# Altium project MD045B.PrjPcb (part 1 of 2)
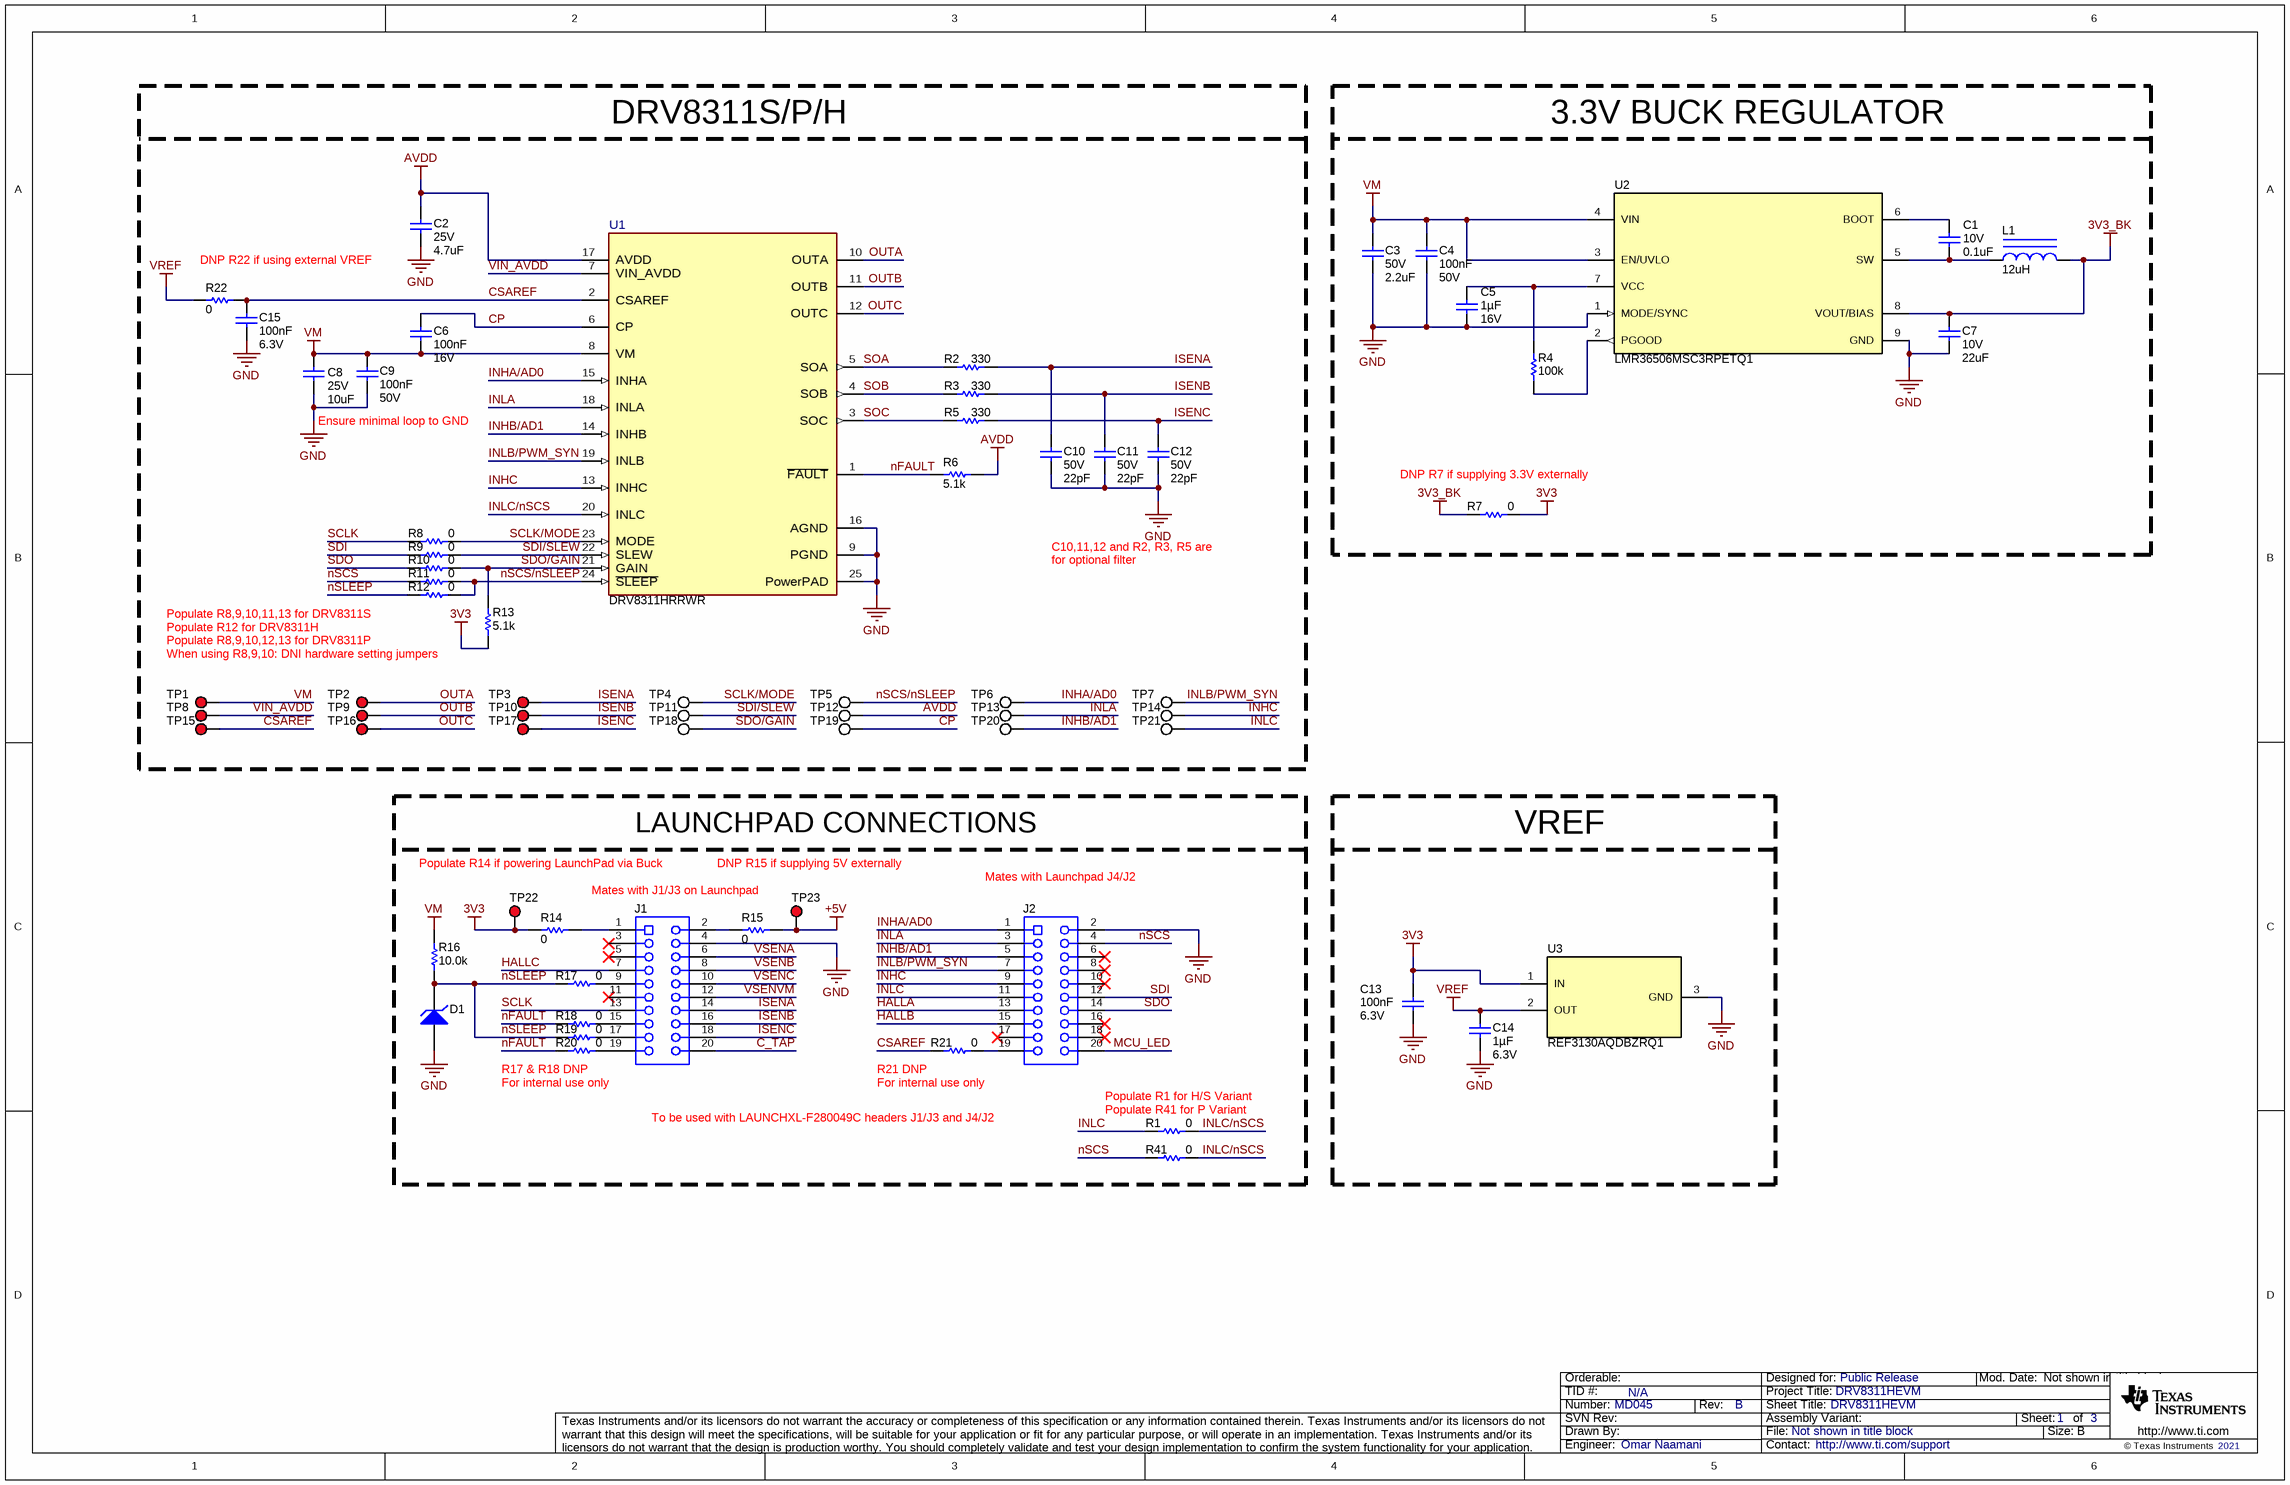
[diagram p0: MD045B_DRIVER.SchDoc]
title: DRV8311HEVM; TID: N/A; TechSupport: http://www.ti.com/support; SCH_Rev: B; PRJ_Title: DRV8311HEVM; PRJ_Number: MD045; PRJ_Engineer: Omar Naamani; PRJ_Customer: Public Release; PCB_Rev: B; PCB_Layout: Omar Naamani; CopyrightYear: 2021
3 sheets, 147 parts. Net scope: global (net labels, ports and power ports of the same name join across sheets).
Board file: MD045B_PCB.PcbDoc
Sheets:
  MD045B_DRIVER.SchDoc
  MD045B_HARDWARE.SchDoc
  MD045B_POWER_AND_CONNECTORS.SchDoc

## Sheet MD045B_DRIVER.SchDoc: DRV8311HEVM
size 431 x 279 mm; Date: Not shown in title block; ApprovedBy: Not shown in title block; CheckedBy: Not shown in title block; Author: Not shown in title block; CompanyName: Not shown in title block; Engineer: Not shown in title block; Organization: Not shown in title block; Address1: Not shown in title block; Address2: Not shown in title block; Address3: Not shown in title block; Address4: Not shown in title block; DocumentNumber: 1; Revision: Use project parameter SCH_Rev; SheetNumber: 1; SheetTotal: 3; PageSetup: Record=PageOptions|CenterHorizontal=True|CenterVertical=True|PrintScale=1.00|XCorrection=1.00|YCorrection=1.00|PrintKind=0|BorderSize=5000000|LeftOffset=0|BottomOffset=0|Orientation=2|PaperLength=1000|PaperWidth=1000|Scale=100|PaperSource=15|PrintQuality=600|MediaType=1|DitherType=10|PaperKind=Letter|PrintScaleMode=1; CurrentTime: Not shown in title block; CurrentDate: Not shown in title block; Time: Not shown in title block; DocumentFullPathAndName: Not shown in title block; DocumentName: Not shown in title block; ModifiedDate: Not shown in title block; ImagePath: Not shown in title block

### Parts
C1  VDC_V: 10V  ValueDisplayed: 0.1uF  [0402L]  (hidden comment: CL05B104KP5NNNC)
C2  VDC_V: 25V  ValueDisplayed: 4.7uF  [0603L]  (hidden comment: GRM188R61E475KE11D)
C3  VDC_V: 50V  ValueDisplayed: 2.2uF  [1210_280]  (hidden comment: C3225X7R1H225K250AB)
C4  Cap_F: 100nF  VDC_V: 50V  [0805L]  (hidden comment: C0805C104K5RACAUTO)
C5  Cap_F: 1µF  VDC_V: 16V  [0603L]  (hidden comment: EMK107B7105KA-T)
C6  Cap_F: 100nF  VDC_V: 16V  [0603L]  (hidden comment: CL10B104KO8NNNC)
C7  VDC_V: 10V  ValueDisplayed: 22uF  [1206_180L]  (hidden comment: GRM31CR71A226KE15L)
C8  VDC_V: 25V  ValueDisplayed: 10uF  [0805L]  (hidden comment: GRM21BC71E106KE11L)
C9  Cap_F: 100nF  VDC_V: 50V  [0805L]  (hidden comment: C0805C104K5RACAUTO)
C10  VDC_V: 50V  ValueDisplayed: 22pF  [0603L]  (hidden comment: CGA3E2C0G1H220J080AA)
C11  VDC_V: 50V  ValueDisplayed: 22pF  [0603L]  (hidden comment: CGA3E2C0G1H220J080AA)
C12  VDC_V: 50V  ValueDisplayed: 22pF  [0603L]  (hidden comment: CGA3E2C0G1H220J080AA)
C13  Cap_F: 100nF  VDC_V: 6.3V  [0603L]  (hidden comment: C0603C104K9RAC7867)
C14  Cap_F: 1µF  VDC_V: 6.3V  [0603L]  (hidden comment: CL10B105KQ8NNNC)
C15  Cap_F: 100nF  VDC_V: 6.3V  [0603L]  (hidden comment: C0603C104K9RAC7867)
D1  SZMM3Z3V3ST1G  [SOD-323]  (value not drawn)
J1  SSQ-110-03-G-D  [Samtec_SSQ-110-03-x-D]  (value not drawn)
J2  SSQ-110-03-G-D  [Samtec_SSQ-110-03-x-D]  (value not drawn)
L1  ValueDisplayed: 12uH  [SDR0805]  (hidden comment: SDR0805-120ML)
R1  ValueDisplayed: 0  [0603L]  (hidden comment: ERJ-3GEY0R00V)
R2  ValueDisplayed: 330  [0603L]  (hidden comment: RC0603FR-07330RL)
R3  ValueDisplayed: 330  [0603L]  (hidden comment: RC0603FR-07330RL)
R4  ValueDisplayed: 100k  [0603L]  (hidden comment: CRCW0603100KFKEA)
R5  ValueDisplayed: 330  [0603L]  (hidden comment: RC0603FR-07330RL)
R6  ValueDisplayed: 5.1k  [0603L]  (hidden comment: CRCW06035K10JNEA)
R7  ValueDisplayed: 0  [0603L]  (hidden comment: ERJ-3GEY0R00V)
R8  ValueDisplayed: 0  [0603L]  (hidden comment: ERJ-3GEY0R00V)
R9  ValueDisplayed: 0  [0603L]  (hidden comment: ERJ-3GEY0R00V)
R10  ValueDisplayed: 0  [0603L]  (hidden comment: ERJ-3GEY0R00V)
R11  ValueDisplayed: 0  [0603L]  (hidden comment: ERJ-3GEY0R00V)
R12  ValueDisplayed: 0  [0603L]  (hidden comment: ERJ-3GEY0R00V)
R13  ValueDisplayed: 5.1k  [0603L]  (hidden comment: CRCW06035K10JNEA)
R14  ValueDisplayed: 0  [0805L]  (hidden comment: ERJ-6GEY0R00V)
R15  ValueDisplayed: 0  [0805L]  (hidden comment: ERJ-6GEY0R00V)
R16  ValueDisplayed: 10.0k  [TNPW0603]  (hidden comment: TNPW060310K0BEEA)
R17  ValueDisplayed: 0  [0603L]  (hidden comment: ERJ-3GEY0R00V)
R18  ValueDisplayed: 0  [0603L]  (hidden comment: ERJ-3GEY0R00V)
R19  ValueDisplayed: 0  [0603L]  (hidden comment: ERJ-3GEY0R00V)
R20  ValueDisplayed: 0  [0603L]  (hidden comment: ERJ-3GEY0R00V)
R21  ValueDisplayed: 0  [0603L]  (hidden comment: ERJ-3GEY0R00V)
R22  ValueDisplayed: 0  [0603L]  (hidden comment: ERJ-3GEY0R00V)
R41  ValueDisplayed: 0  [0603L]  (hidden comment: ERJ-3GEY0R00V)
TP1  VM  [Keystone5000]  (value not drawn)
TP2  OUTA  [Keystone5000]  (value not drawn)
TP3  ISENA  [Keystone5000]  (value not drawn)
TP4  SCLK  [Testpoint_Keystone_Miniature]  (value not drawn)
TP5  nSCS  [Testpoint_Keystone_Miniature]  (value not drawn)
TP6  INHA  [Testpoint_Keystone_Miniature]  (value not drawn)
TP7  INLB  [Testpoint_Keystone_Miniature]  (value not drawn)
TP8  VIN_AVDD  [Keystone5000]  (value not drawn)
TP9  OUTB  [Keystone5000]  (value not drawn)
TP10  ISENB  [Keystone5000]  (value not drawn)
TP11  SDI  [Testpoint_Keystone_Miniature]  (value not drawn)
TP12  AVDD  [Testpoint_Keystone_Miniature]  (value not drawn)
TP13  INLA  [Testpoint_Keystone_Miniature]  (value not drawn)
TP14  INHC  [Testpoint_Keystone_Miniature]  (value not drawn)
TP15  CSAREF  [Keystone5000]  (value not drawn)
TP16  OUTC  [Keystone5000]  (value not drawn)
TP17  ISENC  [Keystone5000]  (value not drawn)
TP18  SDO  [Testpoint_Keystone_Miniature]  (value not drawn)
TP19  CP  [Testpoint_Keystone_Miniature]  (value not drawn)
TP20  INHB  [Testpoint_Keystone_Miniature]  (value not drawn)
TP21  INLC  [Testpoint_Keystone_Miniature]  (value not drawn)
TP22  3V3  [Keystone5000]  (value not drawn)
TP23  5V  [Keystone5000]  (value not drawn)
U1  DRV8311HRRWR  [RRW0024-MFG]
U2  LMR36506MSC3RPETQ1  [RPE0009A]
U3  REF3130AQDBZRQ1  [DBZ0003A_N]

### Blocks framed on the sheet
DRV8311S/P/H: C2 C6 C8-C12 C15 R2 R3 R5 R6 R8-R13 R22 TP1-TP21 U1
3.3V BUCK REGULATOR: C1 C3-C5 C7 L1 R4 R7 U2
LAUNCHPAD CONNECTIONS: D1 J1 J2 R1 R14-R21 R41 TP22 TP23
VREF: C13 C14 U3

### Nets
3V3: C13.1 R7.2 R13.1 R14.1 TP22.1 U3.1(IN)
3V3_BK: C7.1 L1.2 R7.1 U2.8(VOUT/BIAS)
+5V: R15.2 TP23.1
AVDD: C2.1 R6.1 TP12.1 U1.17(AVDD)
GND: C2.2 C3.2 C4.2 C5.2 C7.2 C8.2 C9.2 C10.2 C11.2 C12.2 C13.2 C14.2 C15.2 D1.2(A) J1.4 J2.2 U1.9(PGND) U1.16(AGND) U1.25(PowerPAD) U2.1(MODE/SYNC) U2.9(GND) U3.3(GND)
VIN_AVDD: TP8.1 U1.7(VIN_AVDD)
VM: C3.1 C4.1 C6.2 C8.1 C9.1 R16.2 TP1.1 U1.8(VM) U2.3(EN/UVLO) U2.4(VIN)
VREF: C14.1 R22.2 U3.2(OUT)
C_TAP: J1.20
CP: C6.1 TP19.1 U1.6(CP)
CSAREF: C15.1 R21.1 R22.1 TP15.1 U1.2(CSAREF)
HALLA: J2.13
HALLB: J2.15
HALLC: J1.7
INHA/AD0: J2.1 TP6.1 U1.15(INHA)
INHB/AD1: J2.5 TP20.1 U1.14(INHB)
INHC: J2.9 TP14.1 U1.13(INHC)
INLA: J2.3 TP13.1 U1.18(INLA)
INLB/PWM_SYN: J2.7 TP7.1 U1.19(INLB)
INLC: J2.11 R1.1 TP21.1
INLC/nSCS: R1.2 R41.2 U1.20(INLC)
ISENA: C10.1 J1.14 R2.1 TP3.1
ISENB: C11.1 J1.16 R3.1 TP10.1
ISENC: C12.1 J1.18 R5.1 TP17.1
MCU_LED: J2.20
nFAULT: R6.2 R18.1 R20.1 U1.1(~{FAULT})
nSCS: J2.4 R11.1 R41.1
nSCS/nSLEEP: R11.2 R12.2 TP5.1 U1.24(~{SLEEP})
nSLEEP: D1.1(K) R12.1 R16.1 R17.1 R19.1
OUTA: TP2.1 U1.10(OUTA)
OUTB: TP9.1 U1.11(OUTB)
OUTC: TP16.1 U1.12(OUTC)
SCLK: J1.13 R8.1
SCLK/MODE: R8.2 TP4.1 U1.23(MODE)
SDI: J2.12 R9.1
SDI/SLEW: R9.2 TP11.1 U1.22(SLEW)
SDO: J2.14 R10.1
SDO/GAIN: R10.2 R13.2 TP18.1 U1.21(GAIN)
SOA: R2.2 U1.5(SOA)
SOB: R3.2 U1.4(SOB)
SOC: R5.2 U1.3(SOC)
VSENA: J1.6
VSENB: J1.8
VSENC: J1.10
VSENVM: J1.12
NetC1_1: C1.1 U2.6(BOOT)
NetC1_2: C1.2 L1.1 U2.5(SW)
NetC5_1: C5.1 R4.1 U2.7(VCC)
NetJ1_1: J1.1 R14.2
NetJ1_2: J1.2 R15.1
NetJ1_9: J1.9 R17.2
NetJ1_15: J1.15 R18.2
NetJ1_17: J1.17 R19.2
NetJ1_19: J1.19 R20.2
NetJ2_19: J2.19 R21.2
NetR4_2: R4.2 U2.2(PGOOD)

Not connected (* = marked no-connect by the designer): J1 3* 5* 11*; J2 6* 8* 10* 16* 17* 18*

### Notes on the sheet
- DNP R22 if using external VREF
- Ensure minimal loop to GND
- (near R7) DNP R7 if supplying 3.3V externally
- C10,11,12 and R2, R3, R5 are
- for optional filter
- Populate R8,9,10,11,13 for DRV8311S
- Populate R12 for DRV8311H
- When using R8,9,10: DNI hardware setting jumpers
- Populate R8,9,10,12,13 for DRV8311P
- Populate R14 if powering LaunchPad via Buck
- Mates with J1/J3 on Launchpad
- DNP R15 if supplying 5V externally
- (near J2) Mates with Launchpad J4/J2
- (near R20) R17 & R18 DNP
- For internal use only
- (near R21) R21 DNP
- (near R1) Populate R1 for H/S Variant
- To be used with LAUNCHXL-F280049C headers J1/J3 and J4/J2
- (near R1) Populate R41 for P Variant
- Drawn By:
- SVN Rev:
- Number:
- TID #:
- Orderable:
- Rev:
- Sheet Title:
- File:
- Project Title:
- Designed for:
- Assembly Variant:
- Mod. Date:
- Sheet:
- Size:
- of
- B
- http://www.ti.com
- Texas Instruments and/or its licensors do not warrant the accuracy or completeness of this specification or any information contained therein. Texas Instruments and/or its licensors do not warrant that this design will meet the specifications, will be suitable for your application or fit for any particular purpose, or will operate in an implementation. Texas Instruments and/or its licensors do not warrant that the design is production worthy. You should completely validate and test your design implementation to confirm the system functionality for your application.
- Engineer:
- Contact:
- © Texas Instruments

### Library data of the parts
C1 = CMP-0006343-2: CAP, CERM, 0.1 uF, 10 V, +/- 10%, X7R, 0402; Manufacturer: Samsung Electro-Mechanics; TaMin_C: -55°C; Polarized: N; SizeAreaWB_mm2: 3; Value1: Unknown; U/M: EA; Value: 0.1uF; TaMax_C: 125°C; SizeZ_mm: 0.6; SizeX_mm: 1; SizeY_mm: 0.5; Cap_Case: 0402; Cap_F: 100nF; AEC Category: Q200; Publisher: Texas Instruments; TempCo: X7R; Published: 2008-06-19; RoHS: Y; MountType: SMT; PackageReference: 0402; Tolerance_%: 10%; Value2: 10V; SizeArea_mm2: 0.5; CompType: Capacitor; LatestRevisionDate: 2017-03-09; PartNumber: CL05B104KP5NNNC; AEC Qualified: N; ComponentLink1Description: Datasheet link; AEC Grade: N/A; Technology: Ceramic; ComponentLink1URL: http://www.samsungsem.com/kr/front/downloadcms.do?path=/kr/support/product-search/mlcc/__icsFiles/afieldfile/2014/11/05&fileName=S_CL05B104KP5NNNC.pdf
C2 = CMP-0007347-5: CAP, CERM, 4.7 uF, 25 V, +/- 10%, X5R, 0603; Manufacturer: MuRata; TaMin_C: -55°C; Polarized: N; SizeAreaWB_mm2: 4.68; Value1: Unknown; U/M: EA; Value: 4.7uF; TaMax_C: 85°C; SizeZ_mm: 1; SizeX_mm: 1.6; SizeY_mm: 0.8; Cap_Case: 0603; SizeArea_mm2: 1.28; Cap_F: 4.7µF; AEC Category: Q200; Supplier Part Number 2: 68X2788; Supplier 2: Newark; Supplier Part Number 3: 81-GRM188R61E475KE1D; TempCo: X5R; Supplier 3: Mouser; Published: 2008-06-19; RoHS: Y; MountType: SMT; Supplier 1: Digi-Key; Publisher: Texas Instruments; PackageReference: 0603; Tolerance_%: 10%; Value2: 25V; CompType: Capacitor; LatestRevisionDate: 2017-03-09; PartNumber: GRM188R61E475KE11D; AEC Qualified: N; ComponentLink1Description: Datasheet link; AEC Grade: N/A; Supplier Part Number 1: 490-7203-1-ND; Technology: Ceramic; ComponentLink1URL: http://search.murata.co.jp/Ceramy/image/img/A01X/G101/ENG/GRM188R61E475KE11-01.pdf
C3 = CMP-0009122-1: CAP, CERM, 2.2 uF, 50 V, +/- 10%, X7R, 1210; Manufacturer: TDK; TaMin_C: -55°C; ESR_ohm: 5.36m; Polarized: N; SizeAreaWB_mm2: 14.7; Value1: 0.00536 ohm; U/M: EA; Value: 2.2uF; TaMax_C: 125°C; SizeZ_mm: 2.8; SizeX_mm: 3.2; SizeY_mm: 2.5; SizeArea_mm2: 8; Cap_F: 2.2µF; IRMS_A: 3.17778A; AEC Category: Q200; ComponentLink1URL: https://product.tdk.com/en/search/capacitor/ceramic/mlcc/info?part_no=C3225X7R1H225K250AB; Supplier Part Number 2: 87R4491; Publisher: Texas Instruments; Supplier 2: Newark; Supplier Part Number 3: 810-C3225X7R1H225K11; TempCo: X7R; Supplier 3: Mouser; Published: 2008-06-19; RoHS: Y; MountType: SMT; Supplier 1: Digi-Key; PackageReference: 1210; Tolerance_%: 10%; Cap_Case: 1210_280; Value2: 50V; CompType: Capacitor; LatestRevisionDate: 2017-03-09; PartNumber: C3225X7R1H225K250AB; AEC Qualified: N; ComponentLink1Description: Datasheet link; AEC Grade: N/A; Supplier Part Number 1: 445-1431-1-ND; Technology: Ceramic
C4 C9 = CMP-0007725-2: CAP, CERM, 0.1 uF, 50 V, +/- 10%, X7R, AEC-Q200 Grade 0, 0805; Manufacturer: Kemet; TaMin_C: -55°C; Polarized: N; SizeAreaWB_mm2: 6.75; Value1: Unknown; U/M: EA; Value: 0.1uF; TaMax_C: 125°C; SizeZ_mm: 1.45; SizeX_mm: 2; SizeY_mm: 1.25; Cap_Case: 0805; SizeArea_mm2: 2.5; AEC Qualified: Y; AEC Grade: 0; AEC Category: Q200; Supplier Part Number 2: 86T2620; Publisher: Texas Instruments; Supplier 2: Newark; Supplier Part Number 3: 80-C0805C104K5RAUTO; TempCo: X7R; Supplier 3: Mouser; Published: 2008-06-19; RoHS: Y; MountType: SMT; Supplier 1: Digi-Key; PackageReference: 0805; Tolerance_%: 10%; Value2: 50V; CompType: Capacitor; LatestRevisionDate: 2017-03-09; PartNumber: C0805C104K5RACAUTO; ComponentLink1Description: Datasheet link; Supplier Part Number 1: 399-6928-1-ND; Technology: Ceramic; ValueDisplayed: 0.1uF; ComponentLink1URL: http://www.kemet.com/Lists/ProductCatalog/Attachments/53/KEM_C1002_X7R_SMD.pdf
C5 = CMP-0007120-4: CAP, CERM, 1 uF, 16 V, +/- 10%, X7R, 0603; Manufacturer: Taiyo Yuden; TaMin_C: -55°C; Polarized: N; SizeAreaWB_mm2: 4.68; Value1: Unknown; U/M: EA; Value: 1uF; TaMax_C: 85°C; SizeZ_mm: 1; SizeX_mm: 1.6; SizeY_mm: 0.8; Cap_Case: 0603; SizeArea_mm2: 1.28; AEC Category: Q200; Publisher: Texas Instruments; TempCo: X7R; Published: 2008-06-19; RoHS: Y; MountType: SMT; Supplier 1: Farnell; PackageReference: 0603; Tolerance_%: 10%; Value2: 16V; CompType: Capacitor; LatestRevisionDate: 2017-03-09; PartNumber: EMK107B7105KA-T; AEC Qualified: ?; ComponentLink1Description: Datasheet link; Supplier Part Number 1: 1683647; Technology: Ceramic; ValueDisplayed: 1uF; ComponentLink1URL: http://www.yuden.co.jp/ut/product/pdf/djmk_e.pdf
C6 = CMP-0007110-4: CAP, CERM, 0.1 uF, 16 V, +/- 10%, X7R, 0603; Manufacturer: Samsung Electro-Mechanics; TaMin_C: -55°C; Polarized: N; SizeAreaWB_mm2: 4.68; Value1: Unknown; U/M: EA; Value: 0.1uF; TaMax_C: 125°C; SizeZ_mm: 1; SizeX_mm: 1.6; SizeY_mm: 0.8; Cap_Case: 0603; SizeArea_mm2: 1.28; AEC Category: Q200; Publisher: Texas Instruments; TempCo: X7R; Published: 2008-06-19; RoHS: Y; MountType: SMT; PackageReference: 0603; Tolerance_%: 10%; Value2: 16V; CompType: Capacitor; LatestRevisionDate: 2017-03-09; PartNumber: CL10B104KO8NNNC; AEC Qualified: ?; ComponentLink1Description: Datasheet link; Technology: Ceramic; ValueDisplayed: 0.1uF; ComponentLink1URL: http://www.samsungsem.com/kr/front/downloadcms.do?path=/kr/support/product-search/mlcc/__icsFiles/afieldfile/2014/11/05&fileName=S_CL10B104KO8NNNC.pdf
C7 = CMP-0008959-2: CAP, CERM, 22 uF, 10 V, +/- 10%, X7R, 1206; Manufacturer: MuRata; TaMin_C: -55°C; Polarized: N; SizeAreaWB_mm2: 10.92; Value1: Unknown; U/M: EA; Value: 22uF; TaMax_C: 125°C; SizeZ_mm: 1.8; SizeX_mm: 3.2; SizeY_mm: 1.6; Cap_Case: 1206; SizeArea_mm2: 5.12; Cap_F: 22µF; AEC Category: Q200; Supplier Part Number 2: 81-GRM31CR71A226K15L; Publisher: Texas Instruments; Supplier 2: Mouser; Supplier Part Number 3: 1797016; TempCo: X7R; Supplier 3: Farnell; Published: 2008-06-19; RoHS: Y; MountType: SMT; Supplier 1: Digi-Key; PackageReference: 1206; Tolerance_%: 10%; Value2: 10V; CompType: Capacitor; LatestRevisionDate: 2017-03-09; PartNumber: GRM31CR71A226KE15L; AEC Qualified: ?; ComponentLink1Description: Datasheet link; Supplier Part Number 1: 490-5309-1-ND; Technology: Ceramic; ComponentLink1URL: http://search.murata.co.jp/Ceramy/PnsearchViewAction.do?HnOFG=ON&HnNFG=ON&SEL_CNT=50&sLang=en&sKey=GRM31CR71A226KE15L&x=9&y=9&search=startwith
C8 = CMP-0008262-2: CAP, CERM, 10 uF, 25 V, +/- 10%, X7S, 0805; Manufacturer: MuRata; TaMin_C: -55°C; Polarized: N; SizeAreaWB_mm2: 6.75; Value1: Unknown; U/M: EA; Value: 10uF; TaMax_C: 125°C; SizeZ_mm: 1.45; SizeX_mm: 2; SizeY_mm: 1.25; Cap_Case: 0805; SizeArea_mm2: 2.5; Cap_F: 10µF; AEC Category: Q200; Supplier Part Number 2: 81-GRM21BC71E106KE1L; Publisher: Texas Instruments; Supplier 2: Mouser; TempCo: X7S; Published: 2008-06-19; RoHS: Y; MountType: SMT; Supplier 1: Digi-Key; PackageReference: 0805; Tolerance_%: 10%; Value2: 25V; CompType: Capacitor; LatestRevisionDate: 2017-03-09; PartNumber: GRM21BC71E106KE11L; AEC Qualified: N; ComponentLink1Description: Datasheet link; AEC Grade: N/A; Supplier Part Number 1: 490-10496-1-ND; Technology: Ceramic; ComponentLink1URL: http://psearch.en.murata.com/capacitor/product/GRM21BC71E106KE11%23.pdf
C10-C12 = CMP-0007071-4: CAP, CERM, 22 pF, 50 V, +/- 5%, C0G/NP0, AEC-Q200 Grade 1, 0603; Manufacturer: TDK; TaMin_C: -55°C; Polarized: N; SizeAreaWB_mm2: 4.68; Value1: Unknown; U/M: EA; Value: 22pF; TaMax_C: 125°C; SizeZ_mm: 1; SizeX_mm: 1.6; SizeY_mm: 0.8; Cap_Case: 0603; SizeArea_mm2: 1.28; AEC Qualified: Y; AEC Category: Q200; Supplier Part Number 2: 12T1569; Publisher: Texas Instruments; Supplier 2: Newark; Supplier Part Number 3: 810-CGA3E2C0G1H220J; TempCo: C0G/NP0; Supplier 3: Mouser; Published: 2008-06-19; RoHS: Y; MountType: SMT; Supplier 1: Digi-Key; PackageReference: 0603; Tolerance_%: 5%; Value2: 50V; CompType: Capacitor; LatestRevisionDate: 2017-03-09; PartNumber: CGA3E2C0G1H220J080AA; Cap_F: 22pF; ComponentLink1Description: Datasheet link; AEC Grade: 1; Supplier Part Number 1: 445-5632-1-ND; Technology: Ceramic; ComponentLink1URL: http://product.tdk.com/en/catalog/datasheets/mlcc_automotive_general_en.pdf
C13 C15 = CMP-0086271-1: CAP, CERM, 0.1 µF, 6.3 V,+/- 10%, X7R, 0603; Manufacturer: Kemet; AEC Category: Q200; ValueDisplayed: 0.1µF; Polarized: N; SizeArea_mm2: 1.28; TaMax_C: 125°C; SizeY_mm: 0.8; Value: 0.1uF; SizeAreaWB_mm2: 4.68; SizeZ_mm: 1; Cap_Case: 0603; SizeX_mm: 1.6; U/M: EA; TaMin_C: -55°C; ComponentLink1Description: Datasheet link; TempCo: X7R; Value2: 6.3V; AEC Grade: N/A; AEC Qualified: N; PackageReference: 0603; RoHS: Y; CompType: Capacitor; MountType: SMT; Technology: Ceramic; PartNumber: C0603C104K9RAC7867; Tolerance_%: 10%; ComponentLink1URL: https://api.kemet.com/component-edge/download/datasheet/C0603C104K9RACTU.pdf
C14 = CMP-0007111-4: CAP, CERM, 1 uF, 6.3 V, +/- 10%, X7R, 0603; Manufacturer: Samsung Electro-Mechanics; TaMin_C: -55°C; Polarized: N; SizeAreaWB_mm2: 4.68; Value1: Unknown; U/M: EA; Value: 1uF; TaMax_C: 125°C; SizeZ_mm: 1; SizeX_mm: 1.6; SizeY_mm: 0.8; Cap_Case: 0603; SizeArea_mm2: 1.28; AEC Category: Q200; Publisher: Texas Instruments; TempCo: X7R; Published: 2008-06-19; RoHS: Y; MountType: SMT; PackageReference: 0603; Tolerance_%: 10%; Value2: 6.3V; CompType: Capacitor; LatestRevisionDate: 2017-03-09; PartNumber: CL10B105KQ8NNNC; AEC Qualified: ?; ComponentLink1Description: Datasheet link; Technology: Ceramic; ValueDisplayed: 1uF; ComponentLink1URL: http://www.samsungsem.com/kr/front/downloadcms.do?path=/kr/support/product-search/mlcc/__icsFiles/afieldfile/2014/11/05&fileName=S_CL10B105KQ8NNNC.pdf
D1 = CMP-0085730-1: Diode, Zener, 3.3 V, 300 mW, AEC-Q101, SOD-323; Manufacturer: ON Semiconductor; Value: 3.3V; RJA_CperW: 416; AEC Qualified: Y; SizeArea_mm2: 3.645; SizeX_mm: 2.7; SizeY_mm: 1.35; SizeZ_mm: 1; AEC Category: Q101; SizeAreaWB_mm2: 8.695; Power_W: 300mW; Value1: 0.3W; MountType: SMT; PartNumber: SZMM3Z3V3ST1G; PackageReference: SOD-323; ComponentLink1Description: Datasheet link; CompType: Zener; ComponentLink1URL: https://www.onsemi.com/pub/Collateral/MM3Z2V4ST1-D.PDF; RoHS: Y; Vz_V: 3.3V
J1 J2 = CMP-0075613-1: Receptacle, 2.54mm, 10x2, Gold, TH; Manufacturer: Samtec; Pitch_mm: 2.54; Cert_VDE: N; Gender: Female; Cert_CSA: Y; Current_A: 6.3A; Voltage_V: 550V; CT: True; Row_Count: 2; CompType: Socket Strip; CNHeader: False; ComponentLink1Description: Datasheet URL; RoHS: Y; Cert_UL: Y; Orientation: Vertical; PackageReference: Receptacle, 2.54mm, 10x2, TH; Color: Black; PartNumber: SSQ-110-03-G-D; PinCount: 20; Publisher: Texas Instruments; ContactFinish: Gold; Cert_CULUS: N; RowSpacing_mm: 2.54; ComponentLink1URL: https://www.samtec.com/ftppub/cpdf/SSQ-1XX-XX-XXX-X-XX-XXX-XX-X-MKT.pdf; LatestRevisionDate: 2017-07-12; MountType: TH
L1 = CMP-0057502-2: Inductor, Drum Core, Ferrite, 12 uH, 2 A, 0.08 ohm, SMD; Manufacturer: Bourns; Isat: 3A @ 10% inductance drop; Irms: 2A @ 40C rise; Green_Lifecycle: Active; SizeAreaWB_mm2: 96.04; DCR_ohm: 0.08; Green_REACh: Passed; Value: 12uH; Imax_A: 2A; SizeZ_mm: 5.3; SizeX_mm: 7.8; SizeArea_mm2: 60.84; Ind_H: 12µH; AEC Category: Q200; Supplier Part Number 2: 652-SDR0805-120ML; Publisher: Texas Instruments; Supplier 2: Mouser; Published: 2008-06-26; RoHS: Y; Value1: 0.08 ohm; Material: Ferrite; MountType: SMT; Green_EU RoHS-2: Incomplete; Supplier 1: Digi-Key; Green_EU RoHS: Passed; PackageReference: SDR0805; SizeY_mm: 7.8; Value2: 2A; CompType: Inductor; LatestRevisionDate: 2017-06-02; PartNumber: SDR0805-120ML; AEC Qualified: ?; ComponentLink1Description: Datasheet link; Supplier Part Number 1: SDR0805-120MLCT-ND; Technology: Drum Core; ComponentLink1URL: http://www.bourns.com/data/global/pdfs/SDR0805.pdf
R1 R7-R12 R17-R22 R41 = CMP-0025874-4: RES, 0, 5%, 0.1 W, AEC-Q200 Grade 0, 0603; Manufacturer: Panasonic; Power_W: 100mW; TempCo: 600 ppm/C; Value_Code: 0000; Value: 0; EIA_Code: E24; SizeX_mm: 1.6; SizeY_mm: 0.8; SizeZ_mm: 1; Value2: 0.1W; SizeArea_mm2: 1.28; AEC Qualified: Y; VDC_V: 50V; AEC Category: Q200; SizeAreaWB_mm2: 4.68; Supplier Part Number 2: 667-ERJ-3GEY0R00V; Supplier 2: Mouser; Supplier Part Number 3: 2059527; Supplier 3: Farnell; RoHS: Y; Value1: 5%; MountType: SMT; Supplier 1: Digi-Key; PackageReference: 0603; Tolerance_%: 5%; Res_ohm: 0; CompType: Resistor; PartNumber: ERJ-3GEY0R00V; ComponentLink1Description: Datasheet link; Supplier Part Number 1: P0.0GCT-ND; Technology: Thick Film; ComponentLink1URL: https://industrial.panasonic.com/cdbs/www-data/pdf/RDA0000/AOA0000C301.pdf; AEC Grade: 0
R2 R3 R5 = CMP-0023033-5: RES, 330, 1%, 0.1 W, 0603; Manufacturer: Yageo; Power_W: 100mW; TempCo: 100 ppm/C; Value_Code: 330R; Value: 330; SizeX_mm: 1.6; SizeY_mm: 0.8; SizeZ_mm: 1; Value2: 0.1W; SizeArea_mm2: 1.28; AEC Qualified: N; VDC_V: 75V; AEC Category: Q200; SizeAreaWB_mm2: 4.68; Supplier Part Number 2: 603-RC0603FR-07330RL; Supplier 2: Mouser; Supplier Part Number 3: 9238425; Supplier 3: Farnell; RoHS: Y; Value1: 1%; MountType: SMT; Supplier 1: Digi-Key; PackageReference: 0603; Tolerance_%: 1%; Res_ohm: 330; CompType: Resistor; PartNumber: RC0603FR-07330RL; ComponentLink1Description: Datasheet link; Supplier Part Number 1: 311-330HRCT-ND; Technology: Thick Film; ComponentLink1URL: http://www.yageo.com/pdf/Pu-RC0603_51_PbFree_L_2.pdf; AEC Grade: N/A
R4 = CMP-0021990-4: RES, 100 k, 1%, 0.1 W, AEC-Q200 Grade 0, 0603; Manufacturer: Vishay-Dale; Power_W: 100mW; TempCo: 100 ppm/C; Value: 100k; EIA_Code: E96; SizeX_mm: 1.6; SizeY_mm: 0.8; SizeZ_mm: 1; Value2: 0.1W; SizeArea_mm2: 1.28; AEC Qualified: Y; VDC_V: 75V; AEC Category: Q200; AEC Grade: 0; ComponentLink1URL: http://www.vishay.com/docs/20035/dcrcwe3.pdf; Supplier Part Number 2: 42K3668; Supplier 2: Newark; Supplier Part Number 3: 71-CRCW0603-100K-E3; Supplier 3: Mouser; Value_Code: 100k; RoHS: E; Value1: 1%; MountType: SMT; Supplier 1: Digi-Key; PackageReference: 0603; Tolerance_%: 1%; Res_ohm: 100k; CompType: Resistor; PartNumber: CRCW0603100KFKEA; ComponentLink1Description: Datasheet link; Supplier Part Number 1: 541-100KHCT-ND; Technology: Thick Film
R6 R13 = CMP-0025830-4: RES, 5.1 k, 5%, 0.1 W, AEC-Q200 Grade 0, 0603; Manufacturer: Vishay-Dale; Power_W: 100mW; TempCo: 200 ppm/C; Value_Code: 5k10; Value: 5.1k; EIA_Code: E24; SizeX_mm: 1.6; SizeY_mm: 0.8; SizeZ_mm: 1; Value2: 0.1W; SizeArea_mm2: 1.28; AEC Qualified: Y; VDC_V: 75V; AEC Category: Q200; AEC Grade: 0; ComponentLink1URL: http://www.vishay.com/docs/20035/dcrcwe3.pdf; Supplier Part Number 2: 89M6773; Supplier 2: Newark; Supplier Part Number 3: 1570751; Supplier 3: Farnell; RoHS: E; Value1: 5%; MountType: SMT; Supplier 1: Digi-Key; PackageReference: 0603; Tolerance_%: 5%; Res_ohm: 5.1k; CompType: Resistor; PartNumber: CRCW06035K10JNEA; ComponentLink1Description: Datasheet link; Supplier Part Number 1: 541-5.1KGCT-ND; Technology: Thick Film
R14 R15 = CMP-0020616-3: RES, 0, 5%, 0.125 W, AEC-Q200 Grade 0, 0805; Manufacturer: Panasonic; Power_W: 125mW; TempCo: 600 ppm/C; Value_Code: 0000; Value: 0; EIA_Code: E24; SizeX_mm: 2; SizeY_mm: 1.25; SizeZ_mm: 1.45; Value2: 0.125W; SizeArea_mm2: 2.5; AEC Qualified: Y; VDC_V: 150V; AEC Category: Q200; SizeAreaWB_mm2: 6.75; Supplier Part Number 2: 667-ERJ-6GEY0R00V; Supplier 2: Mouser; Supplier Part Number 3: 2057661; Supplier 3: Farnell; RoHS: Y; Value1: 5%; MountType: SMT; Supplier 1: Digi-Key; PackageReference: 0805; Tolerance_%: 5%; Res_ohm: 0; CompType: Resistor; PartNumber: ERJ-6GEY0R00V; ComponentLink1Description: Datasheet link; Supplier Part Number 1: P0.0ACT-ND; Technology: Thick Film; ComponentLink1URL: https://industrial.panasonic.com/cdbs/www-data/pdf/RDA0000/AOA0000C301.pdf; AEC Grade: 0
R16 = CMP-0025686-1: RES, 10.0 k, 0.1%, 0.1 W, AEC-Q200 Grade 1, 0603; Manufacturer: Vishay-Dale; Power_W: 100mW; TempCo: 25 ppm/C; Value_Code: 10k0; U/M: EA; Value: 10.0k; EIA_Code: E192; Res_ohm: 10k; SizeX_mm: 1.6; SizeY_mm: 0.85; SizeZ_mm: 0.55; Value2: 0.1W; SizeArea_mm2: 1.36; AEC Qualified: Y; VDC_V: 75V; AEC Grade: 1; AEC Category: Q200; ComponentLink1URL: http://www.vishay.com/docs/28758/tnpw_e3.pdf; Supplier Part Number 2: 26R4218; Publisher: Texas Instruments; Supplier 2: Newark; Supplier Part Number 3: 71-TNPW060310K0BEEA; Supplier 3: Mouser; Published: 2008-06-26; RoHS: Y; Value1: 0.1%; MountType: SMT; Supplier 1: Digi-Key; PackageReference: 0603; Tolerance_%: 0.1%; CompType: Resistor; LatestRevisionDate: 2017-03-09; PartNumber: TNPW060310K0BEEA; ComponentLink1Description: Datasheet link; Supplier Part Number 1: TNP10.0KAACT-ND; Technology: Thin Film
TP1-TP3 TP8-TP10 TP15-TP17 TP22 TP23 = CMP-0055137-1: Test Point, Miniature, Red, TH; PartNumber: 5000; Manufacturer: Keystone; ContactFinish: Silver; CNHeader: FALSE; CT: TRUE; Green_Lifecycle: Active; Green_REACh: Passed; PackageReference: Red Miniature Testpoint; CompType: Test Point; RoHS: Y; MountType: TH; ComponentLink1Description: Datasheet URL; ComponentLink1URL: http://www.keyelco.com/userAssets/file/M60-2p60.pdf; Publisher: Texas Instruments; LatestRevisionDate: 26/05/2017; Supplier 1: Digi-Key; Supplier Part Number 1: 36-5000-ND; Supplier 2: Mouser; Supplier Part Number 2: 534-5000; Color: Red; Green_EU RoHS-2: Incomplete; Green_EU RoHS: Passed
TP4-TP7 TP11-TP14 TP18-TP21 = CMP-0055152-1: Test Point, Miniature, SMT; Manufacturer: Keystone; CNHeader: FALSE; Green_Lifecycle: Active; Green_REACh: Passed; CT: TRUE; ComponentLink1URL: http://www.keyelco.com/userAssets/store/files/5015.PDF; Supplier Part Number 2: 534-5015; Publisher: Texas Instruments; Supplier 2: Mouser; RoHS: Y; MountType: SMT; Green_EU RoHS-2: Incomplete; Supplier 1: Digi-Key; Green_EU RoHS: Passed; PackageReference: Testpoint_Keystone_Miniature; CompType: Test Point; LatestRevisionDate: 26/05/2017; PartNumber: 5015; ComponentLink1Description: Datasheet URL; Supplier Part Number 1: 36-5015TR-ND
U1 = CMP-0092942-1: Three-Phase PWM Motor Driver; Manufacturer: Texas Instruments; Motor Type: Brushless DC; Switching Frequency: 200kHz; Nominal Supply Current: 7-9mA; TaMin_C: -40°C; Max Supply Voltage: 20V; Number Of Outputs: 3; Standoff Height: 0mm; Min Supply Voltage: 3V; AEC Qualified: No; TJmax_C: +150°C; SizeZ_mm: 0.9mm; TaMax_C: +125°C; Datasheet Path: datasheets/IC-DRV8311HRRWR.pdf; Part Number: DRV8311HRRWR; Operating Temperature Range: -40°C to +150°C; RoHS: UNKNOWN; PackageReference: QFN24; PartNumber: DRV8311HRRWR; helpURL: https://upverter.com/upn/revision/b6dada0ce4924667/
U2 = CMP-0750089-1: LMR36503/06-Q1 Wide Input 60-V Synchronous, DC-DC Buck Converter, RPE0009A (VQFN-9); Manufacturer: Texas Instruments; Alternate PartNumber: LMR36506MSC3RPERQ1; AEC Category: Q200; SizeAreaWB_mm2: 9; SizeY_mm: 2; AEC Qualified: Y; SizeZ_mm: 1; SizeArea_mm2: 4; CompType: IC; MountType: SMT; ComponentLink2URL: http://www.ti.com/product/lmr36506-q1; ComponentLink3URL: http://www.ti.com/product/lmr36506-q1/datasheet; ComponentLink1URL: http://www.ti.com/lit/ds/symlink/lmr36506-q1.pdf; Alternate Manufacturer: Texas Instruments; ComponentLink3Description: Online Datasheet; PackageReference: RPE0009A; PackageDescription: VQFN-9; ComponentLink2Description: Product Folder; ComponentLink1Description: Datasheet Link; PartNumber: LMR36506MSC3RPETQ1; SizeX_mm: 2
U3 = CMP-0079650-1: Automotive 20 ppm / degC Max, 100 uA, SOT23-3 Series Voltage Reference, DBZ0003A (SOT-23-3); Alternate Manufacturer: Texas Instruments; SizeAreaWB_mm2: 14; SizeZ_mm: 1.12; SizeX_mm: 2.5; SizeY_mm: 3; SizeArea_mm2: 7.5; CompType: IC; AEC Qualified: Y; AEC Category: Q200; ComponentLink1URL: http://www.ti.com/lit/ds/symlink/ref31-q1.pdf; PackageDescription: SOT-23-3; MountType: SMT; ComponentLink2URL: http://www.ti.com/product/ref31-q1; ComponentLink3Description: Online Datasheet; ComponentLink2Description: Product Folder; Manufacturer: Texas Instruments; ComponentLink3URL: http://www.ti.com/product/ref31-q1/datasheet; PackageReference: DBZ0003A; PartNumber: REF3130AQDBZRQ1; ComponentLink1Description: Datasheet Link

## Sheet MD045B_HARDWARE.SchDoc: DRV8311HEVM
size 431 x 279 mm; Date: Not shown in title block; ApprovedBy: Not shown in title block; CheckedBy: Not shown in title block; Author: Not shown in title block; CompanyName: Not shown in title block; Engineer: Not shown in title block; Organization: Not shown in title block; Address1: Not shown in title block; Address2: Not shown in title block; Address3: Not shown in title block; Address4: Not shown in title block; DocumentNumber: 3; Revision: Use project parameter SCH_Rev; SheetNumber: 3; SheetTotal: 3; PageSetup: Record=PageOptions|CenterHorizontal=True|CenterVertical=True|PrintScale=1.00|XCorrection=1.00|YCorrection=1.00|PrintKind=0|BorderSize=5000000|LeftOffset=0|BottomOffset=0|Orientation=2|PaperLength=1000|PaperWidth=1000|Scale=100|PaperSource=15|PrintQuality=600|MediaType=1|DitherType=10|PaperKind=Letter|PrintScaleMode=1; CurrentTime: Not shown in title block; CurrentDate: Not shown in title block; Time: Not shown in title block; DocumentFullPathAndName: Not shown in title block; DocumentName: Not shown in title block; ModifiedDate: Not shown in title block; ImagePath: Not shown in title block
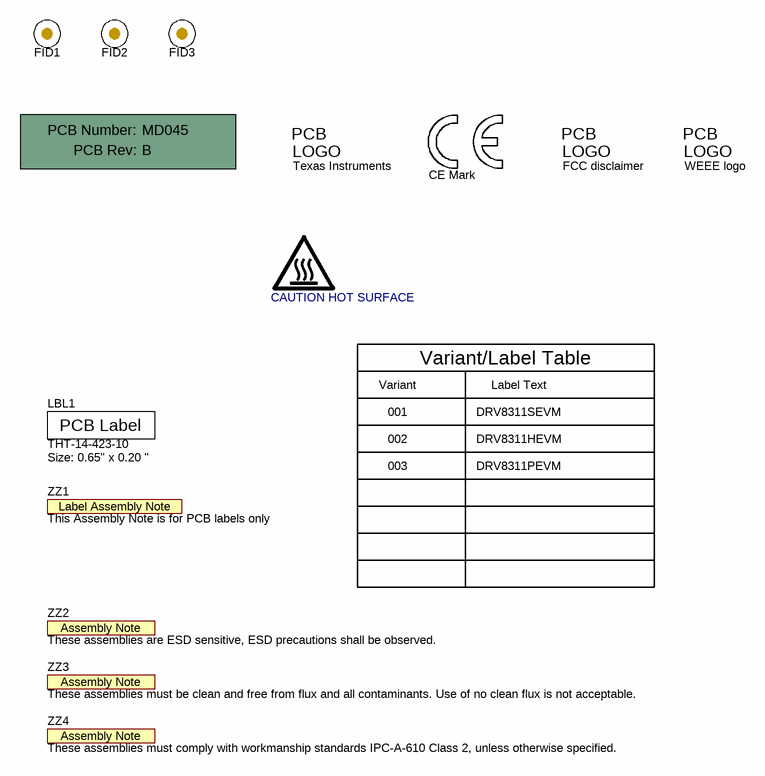
[diagram p1: MD045B_HARDWARE.SchDoc]

### Parts
!PCB1  Printed Circuit Board  (value not drawn)  (mechanical)
FID1  Fiducial  [Fiducial10-20]  (value not drawn)
FID2  Fiducial  [Fiducial10-20]  (value not drawn)
FID3  Fiducial  [Fiducial10-20]  (value not drawn)
LBL1  THT-14-423-10  Note: Size: 0.65" x 0.20 "  [Label_650x200]
Logo1  CE Mark  [CE_Mark_5mm]  (no BOM)
Logo2  Texas Instruments  [TI_Stacked_Overlay_Small]  (no BOM)
Logo3  FCC disclaimer  [FCC_disclaimer]  (no BOM)
Logo4  WEEE logo  [WEEE_Minimum]  (no BOM)
LOGO5  CAUTION HOT SURFACE  [IEC_HotSurface_Small]  (no BOM)
ZZ1  This Assembly Note is for PCB labels only  [AssemblyNoteLabel]  (no BOM)
ZZ2  These assemblies are ESD sensitive, ESD precautions shall be observed.  [AssemblyNote]  (no BOM)
ZZ3  These assemblies must be clean and free from flux and all contaminants. Use of no clean flux is not acceptable.  [AssemblyNote]  (no BOM)
ZZ4  These assemblies must comply with workmanship standards IPC-A-610 Class 2, unless otherwise specified.  [AssemblyNote]  (no BOM)

### Notes on the sheet
- Variant
- Variant/Label Table
- Label Text
- 001
- 002
- DRV8311SEVM
- DRV8311HEVM
- 003
- DRV8311PEVM
- Drawn By:
- SVN Rev:
- Number:
- TID #:
- Orderable:
- Rev:
- Sheet Title:
- File:
- Project Title:
- Designed for:
- Assembly Variant:
- Mod. Date:
- Sheet:
- Size:
- of
- B
- http://www.ti.com
- Texas Instruments and/or its licensors do not warrant the accuracy or completeness of this specification or any information contained therein. Texas Instruments and/or its licensors do not warrant that this design will meet the specifications, will be suitable for your application or fit for any particular purpose, or will operate in an implementation. Texas Instruments and/or its licensors do not warrant that the design is production worthy. You should completely validate and test your design implementation to confirm the system functionality for your application.
- Engineer:
- Contact:
- © Texas Instruments
- (in symbol CMP-0003616-3) Label Assembly Note
- (in symbol CMP-0003618-2) PCB Number:; PCB Rev:
- (in symbol CMP-0003625-1) PCB Label
- (in symbol CMP-0074769-1) PCB; LOGO
- (in symbol CMP-0074838-1) PCB; LOGO
- (in symbol CMP-0074847-1) PCB; LOGO

### Library data of the parts
!PCB1 = CMP-0003618-2: Manufacturer: Any; PartNumber: MD045; CompType: PCB; RoHS: O; MountType: N/A; Publisher: Texas Instruments; LatestRevisionDate: 2017-03-09; Key: PCB
FID1-FID3 = CMP-0077181-1: Fiducial mark.  There is nothing to buy or mount.; CompType: Fiducial; Manufacturer: N/A; MountType: N/A; PackageReference: N/A; PartNumber: N/A; ClassName: FiducialMark; Library Reference: Fiducial
LBL1 = CMP-0003625-1: Thermal Transfer Printable Labels, 0.650" W x 0.200" H - 10,000 per roll; Manufacturer: Brady; CompType: Label; ClassName: Label; PartNumber: THT-14-423-10; RoHS: Y; PackageReference: PCB Label 0.650 x 0.200 inch; MountType: N/A; ComponentLink1Description: Web Page; ComponentLink1URL: http://www.bradyid.com/bradyid/pdpv/THT-14-423-10.html; Publisher: Texas Instruments; LatestRevisionDate: 2017-03-09; Supplier 1: Newark; Supplier Part Number 1: 97C5133; Supplier 2: Farnell; Supplier Part Number 2: 2065596; Key: THT-14-423-10
Logo1 = CMP-0074844-1: SymbolCreator: a0412235; Published: 2009-03-03; Publisher: Texas Instruments; LatestRevisionDate: 2017-07-06; Lib Reference: CE Mark; PartNumber: CE Mark; Library Reference: CE Mark
Logo2 = CMP-0074838-1: Texas Instrument Corporate Signature; SymbolCreator: a0412235; Lib Reference: TI_Logo; Library Reference: Logo; SymbolVersion: 2011-08-22; Published: 2009-03-03; Publisher: Texas Instruments; ClassName: Logo; LatestRevisionDate: 2017-07-06; PartNumber: Texas Instruments
Logo3 = CMP-0074847-1: FCC_disclaimer; Library Reference: Logo; Published: 2009-03-03; Publisher: Texas Instruments; LatestRevisionDate: 2017-07-06; Lib Reference: FCC_disclaimer; PartNumber: FCC disclaimer
Logo4 = CMP-0074769-1: Library Reference: WEEE logo; Lib Reference: WEEE logo; PartNumber: WEEE logo
LOGO5 = CMP-0074837-1: IEC 61010-1 Hot Surface Warning; SymbolCreator: a0412235; Library Reference: IEC_HotSurface; Publisher: Texas Instruments; SymbolVersion: 2011-08-22; Published: 2009-03-03; Lib Reference: IEC_HotSurface; LatestRevisionDate: 2017-07-06; PartNumber: CAUTION HOT SURFACE
ZZ1 = CMP-0003616-3: CompType: AssemblyNote; ClassName: AssemblyNote; Publisher: Texas Instruments; LatestRevisionDate: 2017-03-09; Key: AssemblyNoteLabel
ZZ2 = CMP-0077236-1: CompType: AssemblyNote; ClassName: AssemblyNote; Publisher: Texas Instruments; LatestRevisionDate: 2017-08-10; Key: AssemblyNote
ZZ3 = CMP-0077237-1: CompType: AssemblyNote; ClassName: AssemblyNote; Publisher: Texas Instruments; LatestRevisionDate: 2017-08-10; Key: AssemblyNote
ZZ4 = CMP-0077238-1: CompType: AssemblyNote; ClassName: AssemblyNote; Publisher: Texas Instruments; LatestRevisionDate: 2017-08-10; Key: AssemblyNote